# Altium schematic sheet Kerf_Step3_Binding_Review.SchDoc
size A; SheetNumber: 1; SheetTotal: 1
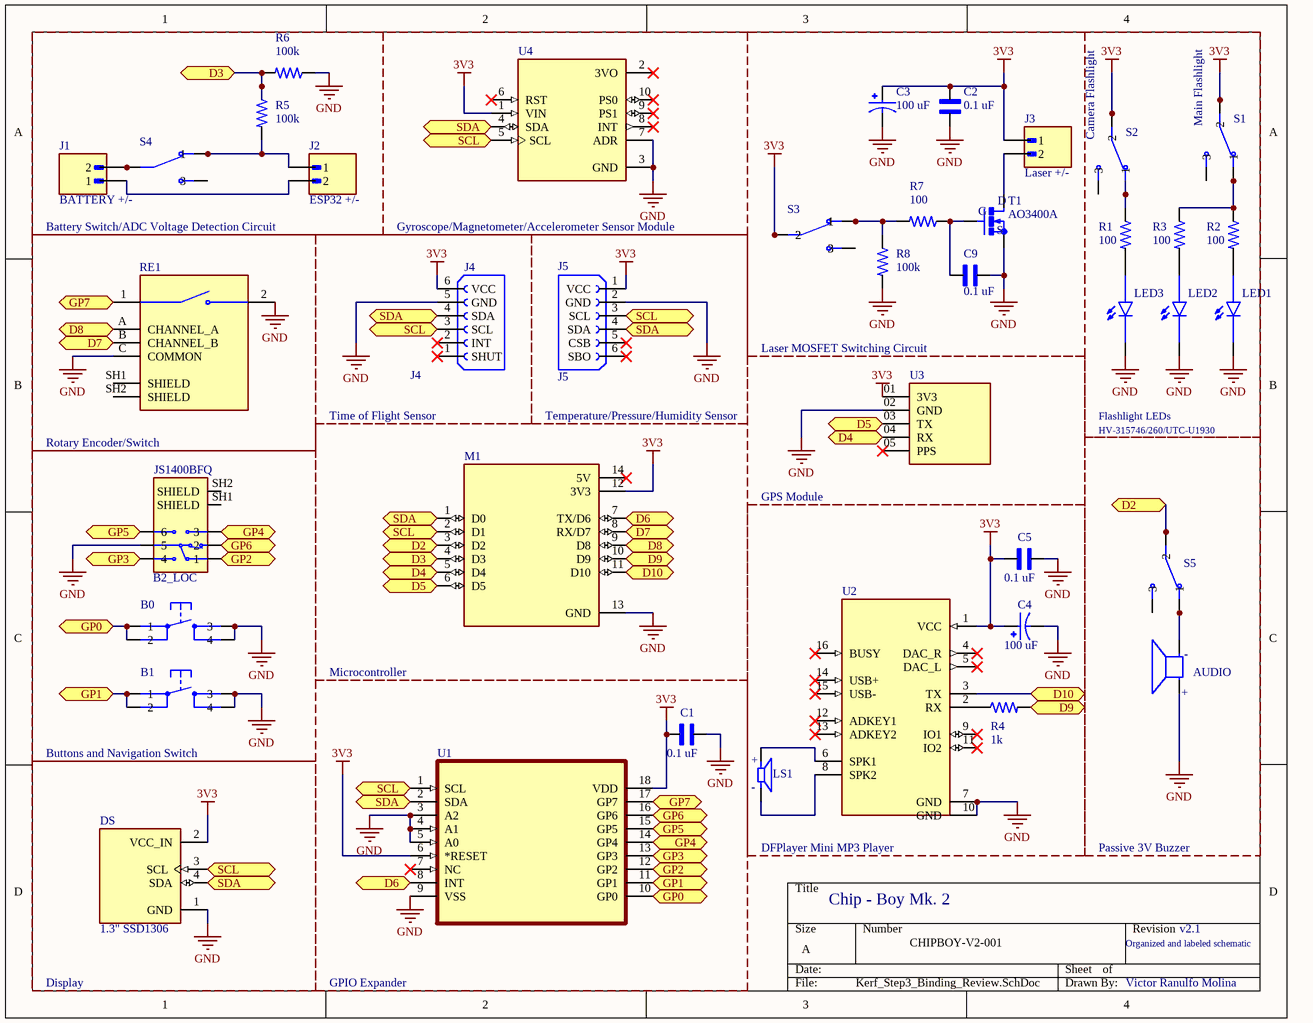
[diagram p0: Kerf_Step3_Binding_Review.SchDoc]

## Parts
AUDIO  (no value)  [Kerf_AUDIO_original]
B0  SKHHANA010  [Kerf_B0_original]  (value not drawn)
B1  SKHHANA010  [Kerf_B1_original]  (value not drawn)
B2_LOC  JS1400BFQ  [Kerf_B2_LOC_original]
C1  0.1 uF  [Kerf_C1_original]
C2  0.1 uF  [Kerf_C2_original]
C3  100 uF  [Kerf_C3_original]
C4  100 uF  [Kerf_C4_original]
C5  0.1 uF  [Kerf_C5_original]
C9  0.1 uF  [Kerf_C9_original]
DS  1.3" SSD1306  [Kerf_DS_original]
J1  BATTERY +/-  [Kerf_J1_original]
J2  ESP32 +/-  [Kerf_J2_original]
J3  Laser +/-  [Kerf_J3_original]
J4  J4  [Kerf_J4_original]
J5  J5  [Kerf_J5_original]
LED1  led_through_hole  [Kerf_LED1_original]  (value not drawn)
LED2  led_through_hole  [Kerf_LED2_original]  (value not drawn)
LED3  led_through_hole  [Kerf_LED3_original]  (value not drawn)
LS1  15mm speaker  [Kerf_LS1_original]  (value not drawn)
M1  (no value)  [Kerf_M1_original]
R1  100  [Kerf_R1_original]
R2  100  [Kerf_R2_original]
R3  100  [Kerf_R3_original]
R4  1k  [Kerf_R4_original]
R5  100k  [Kerf_R5_original]
R6  100k  [Kerf_R6_original]
R7  100  [Kerf_R7_original]
R8  100k  [Kerf_R8_original]
RE1  rotary encoder  [Kerf_RE1_original]  (value not drawn)
S1  Main Flashlight  [Kerf_S1_original]
S2  Camera Flashlight  [Kerf_S2_original]
S3  switch top actuated  [Kerf_S3_original]  (value not drawn)
S4  switch top actuated  [Kerf_S4_original]  (value not drawn)
S5  switch top actuated  [Kerf_S5_original]  (value not drawn)
T1  AO3400A  [Kerf_T1_original]
U1  gpio extender  [Kerf_U1_original]  (value not drawn)
U2  DFPLAYER  [Kerf_U2_original]  (value not drawn)
U3  ATGM336H  [Kerf_U3_original]  (value not drawn)
U4  BNO055  [Kerf_U4_original]  (value not drawn)

## Blocks framed on the sheet
Battery Switch/ADC Voltage Detection Circuit: J1 J2 R5 R6 S4
Gyroscope/Magnetometer/Accelerometer Sensor Module: U4
Laser MOSFET Switching Circuit: C2 C3 C9 J3 R7 R8 S3 T1
Flashlight LEDs: LED1-LED3 R1-R3 S1 S2
Temperature/Pressure/Humidity Sensor: J5
Passive 3V Buzzer: AUDIO S5

## Ports
D2 (bidir, see CHIPBOY_Mk_II[2C]), D2 (bidir, see CHIPBOY_Mk_II[4B]), D3 (bidir, see CHIPBOY_Mk_II[1A]), D3 (bidir, see CHIPBOY_Mk_II[2C]), D4 (bidir, see CHIPBOY_Mk_II[2C]), D4 (bidir, see CHIPBOY_Mk_II[3B]), D5 (bidir, see CHIPBOY_Mk_II[2C]), D5 (bidir, see CHIPBOY_Mk_II[3B]), D6 (bidir, see CHIPBOY_Mk_II[2C]), D6 (bidir, see CHIPBOY_Mk_II[2D]), D7 (bidir, see CHIPBOY_Mk_II[1B]), D7 (bidir, see CHIPBOY_Mk_II[2C]), D8 (bidir, see CHIPBOY_Mk_II[1B]), D8 (bidir, see CHIPBOY_Mk_II[2C]), D9 (bidir, see CHIPBOY_Mk_II[2C]), D9 (bidir, see CHIPBOY_Mk_II[4C]), D10 (bidir, see CHIPBOY_Mk_II[2C]), D10 (bidir, see CHIPBOY_Mk_II[4C]), GP0 (bidir, see CHIPBOY_Mk_II[1C]), GP0 (bidir, see CHIPBOY_Mk_II[3D]), GP1 (bidir, see CHIPBOY_Mk_II[1C]), GP1 (bidir, see CHIPBOY_Mk_II[3D]), GP2 (bidir, see CHIPBOY_Mk_II[1C]), GP2 (bidir, see CHIPBOY_Mk_II[3D]), GP3 (bidir, see CHIPBOY_Mk_II[1C]), GP3 (bidir, see CHIPBOY_Mk_II[3D]), GP4 (bidir, see CHIPBOY_Mk_II[1C]), GP4 (bidir, see CHIPBOY_Mk_II[3D]), GP5 (bidir, see CHIPBOY_Mk_II[1C]), GP5 (bidir, see CHIPBOY_Mk_II[3D]), GP6 (bidir, see CHIPBOY_Mk_II[1C]), GP6 (bidir, see CHIPBOY_Mk_II[3D]), GP7 (bidir, see CHIPBOY_Mk_II[1B]), GP7 (bidir, see CHIPBOY_Mk_II[3D]), SCL (bidir, see CHIPBOY_Mk_II[1D], CHIPBOY_Mk_II[2A], CHIPBOY_Mk_II[2B], CHIPBOY_Mk_II[2C]), SCL (bidir, see CHIPBOY_Mk_II[1D], CHIPBOY_Mk_II[2A], CHIPBOY_Mk_II[2B], CHIPBOY_Mk_II[2C], CHIPBOY_Mk_II[2D]), SCL (bidir, see CHIPBOY_Mk_II[1D], CHIPBOY_Mk_II[2A], CHIPBOY_Mk_II[2B], CHIPBOY_Mk_II[2D]), SCL (bidir, see CHIPBOY_Mk_II[1D], CHIPBOY_Mk_II[2B], CHIPBOY_Mk_II[2C], CHIPBOY_Mk_II[2D]), SCL (bidir, see CHIPBOY_Mk_II[2A], CHIPBOY_Mk_II[2B], CHIPBOY_Mk_II[2C], CHIPBOY_Mk_II[2D]), SDA (bidir, see CHIPBOY_Mk_II[1D], CHIPBOY_Mk_II[2A], CHIPBOY_Mk_II[2B], CHIPBOY_Mk_II[2C]), SDA (bidir, see CHIPBOY_Mk_II[1D], CHIPBOY_Mk_II[2A], CHIPBOY_Mk_II[2B], CHIPBOY_Mk_II[2C], CHIPBOY_Mk_II[2D]), SDA (bidir, see CHIPBOY_Mk_II[1D], CHIPBOY_Mk_II[2A], CHIPBOY_Mk_II[2B], CHIPBOY_Mk_II[2D]), SDA (bidir, see CHIPBOY_Mk_II[1D], CHIPBOY_Mk_II[2B], CHIPBOY_Mk_II[2C], CHIPBOY_Mk_II[2D]), SDA (bidir, see CHIPBOY_Mk_II[2A], CHIPBOY_Mk_II[2B], CHIPBOY_Mk_II[2C], CHIPBOY_Mk_II[2D])

## Nets
3V3: C1.1 C2.1 C3.1 C4.1 C5.1 DS.2(VCC_IN) J3.1 J4.6(VCC) J5.1(VCC) M1.12(3V3) S1.3(2) S1.4 S2.3(2) S2.4 S3.3(2) S3.4(2) U1.6(*RESET) U1.18(VDD) U2.1(VCC) U3.01(3V3) U4.1(VIN)
GND: AUDIO.P B0.3 B0.4 B1.3 B1.4 B2_LOC.5 C1.2 C2.2 C3.2 C4.2 C5.2 C9.1 DS.1(GND) J4.5(GND) J5.2(GND) LED1.C LED2.C LED3.C M1.13(GND) R6.1 R8.2 RE1.2 RE1.C(COMMON) T1.2(S) U1.3(A2) U1.4(A1) U1.5(A0) U1.9(VSS) U2.7(GND) U2.10(GND) U3.02(GND) U4.3(GND) U4.7(ADR)
D2: M1.3(D2) S5.3(2) S5.4 ; port D2
D3: M1.4(D3) R5.1 R6.2 ; port D3
D4: M1.5(D4) U3.04(RX) ; port D4
D5: M1.6(D5) U3.03(TX) ; port D5
D6: M1.7(TX/D6) U1.8(INT) ; port D6
D7: M1.8(RX/D7) RE1.B(CHANNEL_B) ; port D7
D8: M1.9(D8) RE1.A(CHANNEL_A) ; port D8
D9: M1.10(D9) R4.2 ; port D9
D10: M1.11(D10) U2.3(TX) ; port D10
GP0: B0.1 B0.2 U1.10(GP0) ; port GP0
GP1: B1.1 B1.2 U1.11(GP1) ; port GP1
GP2: B2_LOC.1 U1.12(GP2) ; port GP2
GP3: B2_LOC.4 U1.13(GP3) ; port GP3
GP4: B2_LOC.3 U1.14(GP4) ; port GP4
GP5: B2_LOC.6 U1.15(GP5) ; port GP5
GP6: B2_LOC.2 U1.16(GP6) ; port GP6
GP7: RE1.1 U1.17(GP7) ; port GP7
SCL: DS.3(SCL) J4.3(SCL) J5.3(SCL) M1.2(D1) U1.1(SCL) U4.5(SCL) ; port SCL
SDA: DS.4(SDA) J4.4(SDA) J5.4(SDA) M1.1(D0) U1.2(SDA) U4.4(SDA) ; port SDA
NetAUDIO_N: AUDIO.N S5.1 S5.2
NetC9_2: C9.2 R7.1 T1.1(G)
NetJ1_1: J1.1 J2.2
NetJ1_2: J1.2 S4.3 S4.4
NetJ2_1: J2.1 R5.2 S4.1 S4.2
NetJ3_2: J3.2 T1.3(D)
NetLED1_A: LED1.A R2.2
NetLED2_A: LED2.A R3.2
NetLED3_A: LED3.A R1.2
NetLS1_1: LS1.1(P) U2.6(SPK1)
NetLS1_2: LS1.2(M) U2.8(SPK2)
NetR1_1: R1.1 S2.1 S2.2
NetR2_1: R2.1 R3.1 S1.1 S1.2
NetR4_1: R4.1 U2.2(RX)
NetR7_2: R7.2 R8.1 S3.1 S3.2(1)
NetS1_5: S1.5(3) S1.6
NetS2_5: S2.5(3) S2.6
NetS3_5: S3.5(3) S3.6(3)
NetS4_5: S4.5(3) S4.6
NetS5_5: S5.5(3) S5.6

Not connected (* = marked no-connect by the designer): B2_LOC SH1(SHIELD) SH2(SHIELD); J4 1(SHUT)* 2(INT)*; J5 5(CSB)* 6(SBO)*; M1 14(5V)*; RE1 SH1(SHIELD) SH2(SHIELD); U1 7(NC)*; U2 4(DAC_R)* 5(DAC_L)* 9(IO1)* 11(IO2)* 12(ADKEY1)* 13(ADKEY2)* 14(USB+)* 15(USB-)* 16(BUSY)*; U3 05(PPS)*; U4 2(3VO)* 6(RST)* 8(INT)* 9(PS1)* 10(PS0)*

## Notes on the sheet
- Time of Flight Sensor
- HV-315746/260/UTC-U1930
- Rotary Encoder/Switch
- GPS Module
- Microcontroller
- (near B1) Buttons and Navigation Switch
- (near U2) DFPlayer Mini MP3 Player
- Chip - Boy Mk. 2
- CHIPBOY-V2-001
- Organized and labeled schematic
- v2.1
- Display
- GPIO Expander
- Victor Ranulfo Molina
- (in symbol Kerf_AUDIO_review_symbol) -; +
- (in symbol Kerf_LS1_review_symbol) +; -

## Library data of the parts
AUDIO = Kerf_AUDIO_review_symbol
B0 = Kerf_B0_review_symbol
B1 = Kerf_B1_review_symbol
B2_LOC = Kerf_B2_LOC_review_symbol
C1 = Kerf_C1_review_symbol
C2 = Kerf_C2_review_symbol
C3 = Kerf_C3_review_symbol
C4 = Kerf_C4_review_symbol
C5 = Kerf_C5_review_symbol
C9 = Kerf_C9_review_symbol
DS = Kerf_DS_review_symbol
J1 = Kerf_J1_review_symbol
J2 = Kerf_J2_review_symbol
J3 = Kerf_J3_review_symbol
J4 = Kerf_J4_review_symbol
J5 = Kerf_J5_review_symbol
LED1 = Kerf_LED1_review_symbol
LED2 = Kerf_LED2_review_symbol
LED3 = Kerf_LED3_review_symbol
LS1 = Kerf_LS1_review_symbol
M1 = Kerf_M1_review_symbol
R1 = Kerf_R1_review_symbol
R2 = Kerf_R2_review_symbol
R3 = Kerf_R3_review_symbol
R4 = Kerf_R4_review_symbol
R5 = Kerf_R5_review_symbol
R6 = Kerf_R6_review_symbol
R7 = Kerf_R7_review_symbol
R8 = Kerf_R8_review_symbol
RE1 = Kerf_RE1_review_symbol
S1 = Kerf_S1_review_symbol
S2 = Kerf_S2_review_symbol
S3 = Kerf_S3_review_symbol
S4 = Kerf_S4_review_symbol
S5 = Kerf_S5_review_symbol
T1 = Kerf_T1_review_symbol
U1 = Kerf_U1_review_symbol
U2 = Kerf_U2_review_symbol
U3 = Kerf_U3_review_symbol
U4 = Kerf_U4_review_symbol